# Altium schematic sheet Lighting.SchDoc
size A; SheetNumber: 11; SheetTotal: 12
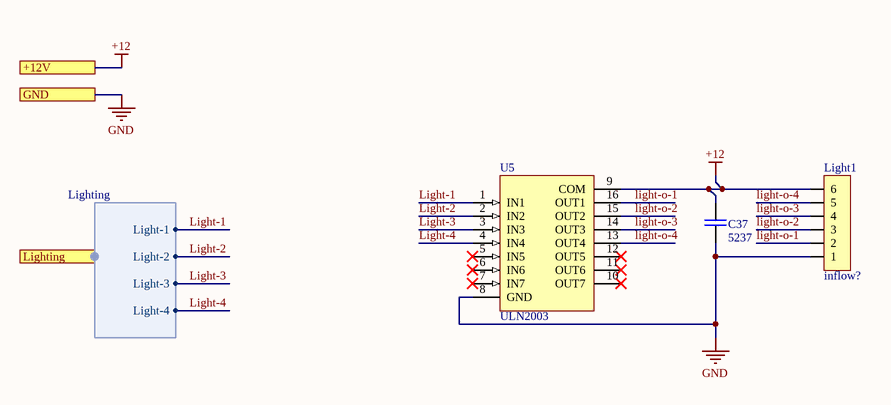
[diagram p0: Lighting.SchDoc]

## Parts
C37  Inflow: 5237  [CAP 1206/3216]  (hidden comment: 1u'F, 50'V)
Light1  Inflow: inflow?  [MOLEX KK 0022272061]  (hidden comment: 6'Pin)
U5  ULN2003  [SO16_M]

## Ports
+12V, GND, Lighting (harness Lighting)

## Harnesses
Lighting: Light-1, Light-2, Light-3, Light-4

## Nets
+12: C37.2 Light1.6 U5.9(COM) ; port +12V
GND: C37.1 Light1.1 U5.8(GND) ; port GND
Light-1: U5.1(IN1) ; port Lighting.Light-1
Light-2: U5.2(IN2) ; port Lighting.Light-2
Light-3: U5.3(IN3) ; port Lighting.Light-3
Light-4: U5.4(IN4) ; port Lighting.Light-4
light-o-1: Light1.2 U5.16(OUT1)
light-o-2: Light1.3 U5.15(OUT2)
light-o-3: Light1.4 U5.14(OUT3)
light-o-4: Light1.5 U5.13(OUT4)

Not connected (* = marked no-connect by the designer): U5 5(IN5)* 6(IN6)* 7(IN7)* 10(OUT7)* 11(OUT6)* 12(OUT5)*

## Library data of the parts
C37 = Cap_Multi_1u_50_1206: Bipolar ceramic capacitor SMD; Rating: Rating?; Type: Type?; Validation: Valid; Value: 1u'F, 50'V; Package: Package?
Light1 = Con_Signal_6: Signal Connector 6'Pin; Rating: Rating?; Validation: Valid; Value: 6'Pin; Package: Package?; Type: Type?
U5 = IC_Driver_ULN2003: Seven darlington array drivers; Rating: Rating?; Validation: Valid; Inflow: 1506; Package: SO-16; Type: Driver; Value: ULN2003